# EasyEDA Pro project Zuko.epro, board Honor
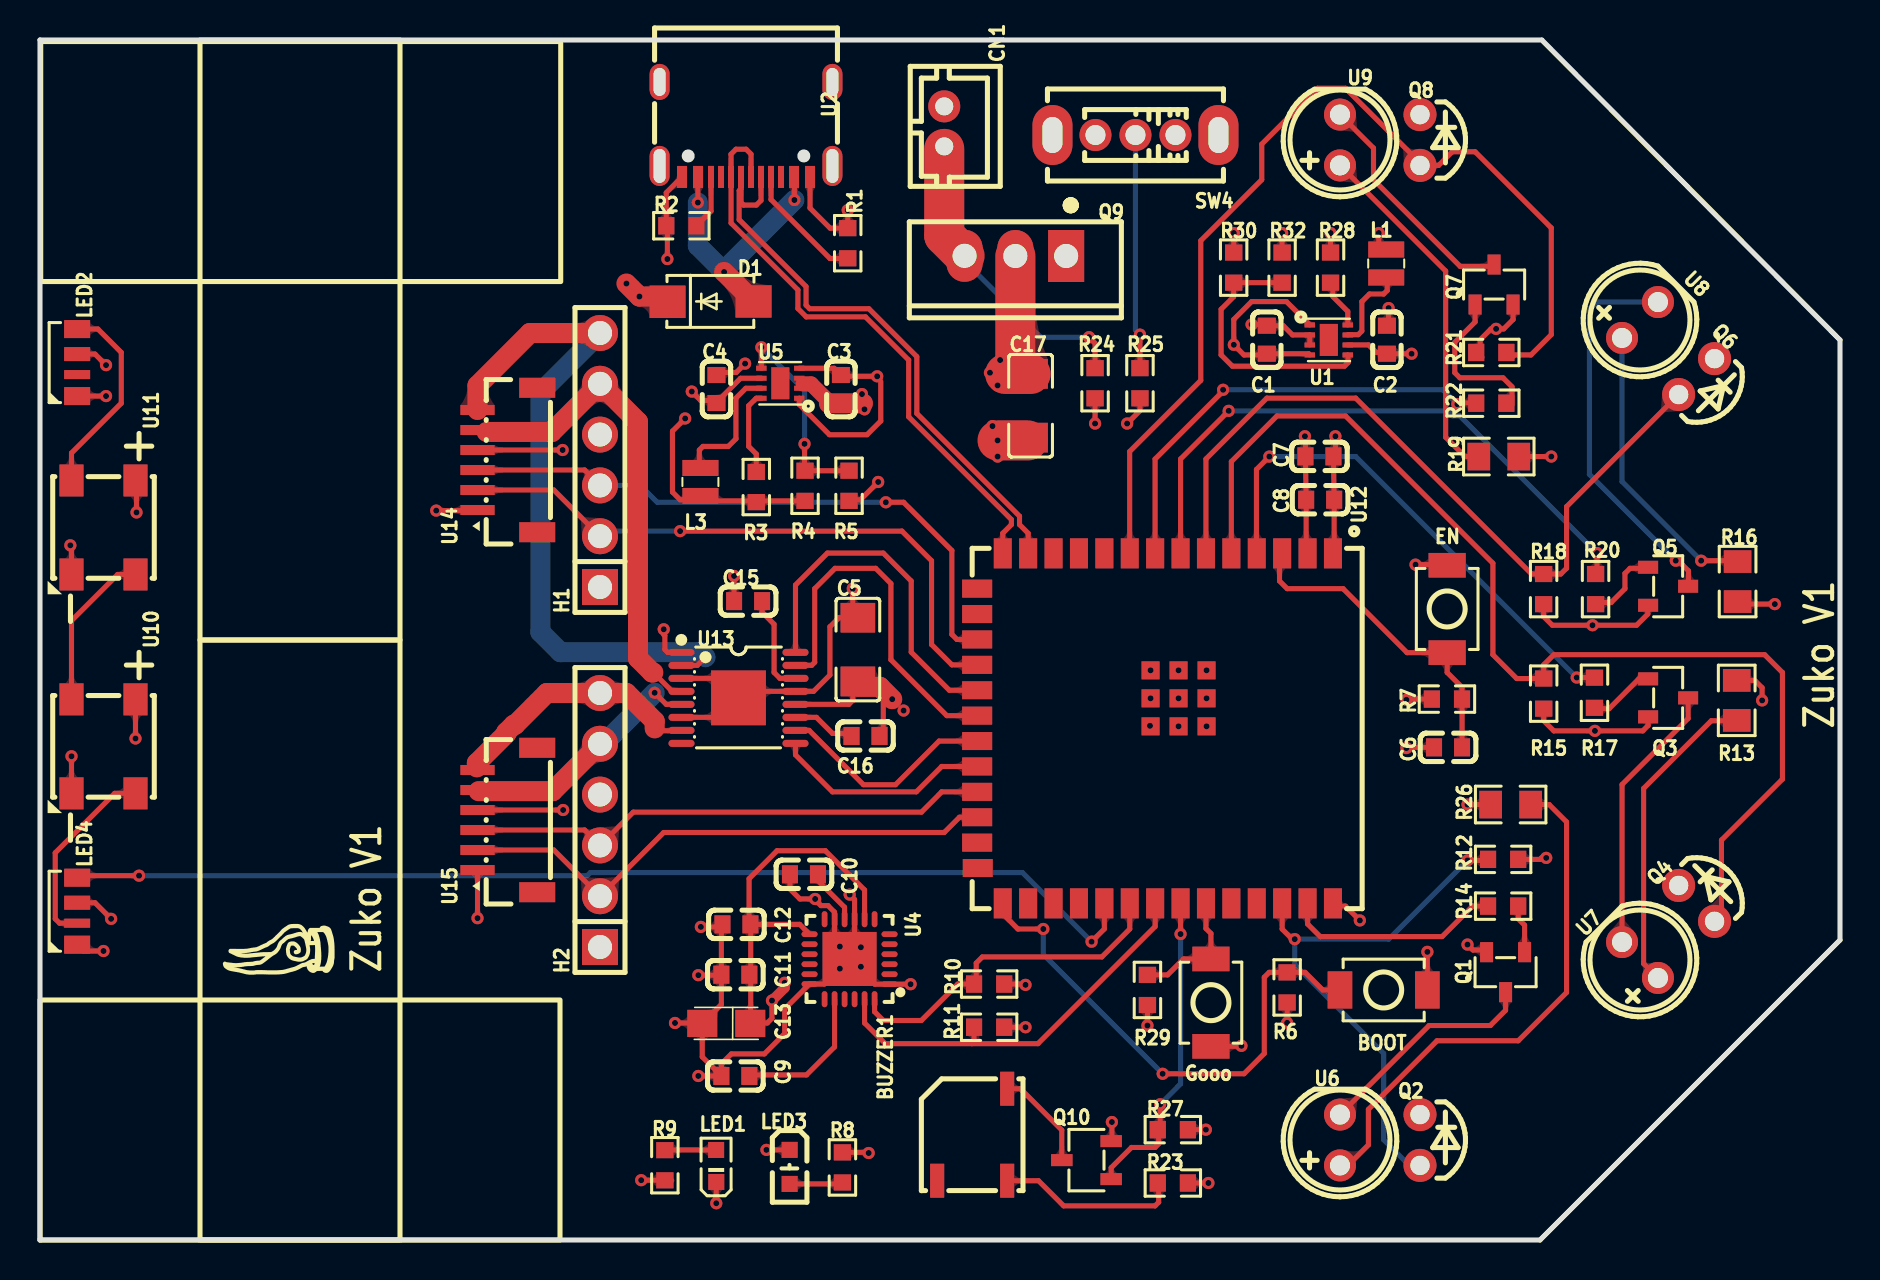
[diagram p1: board, top side]
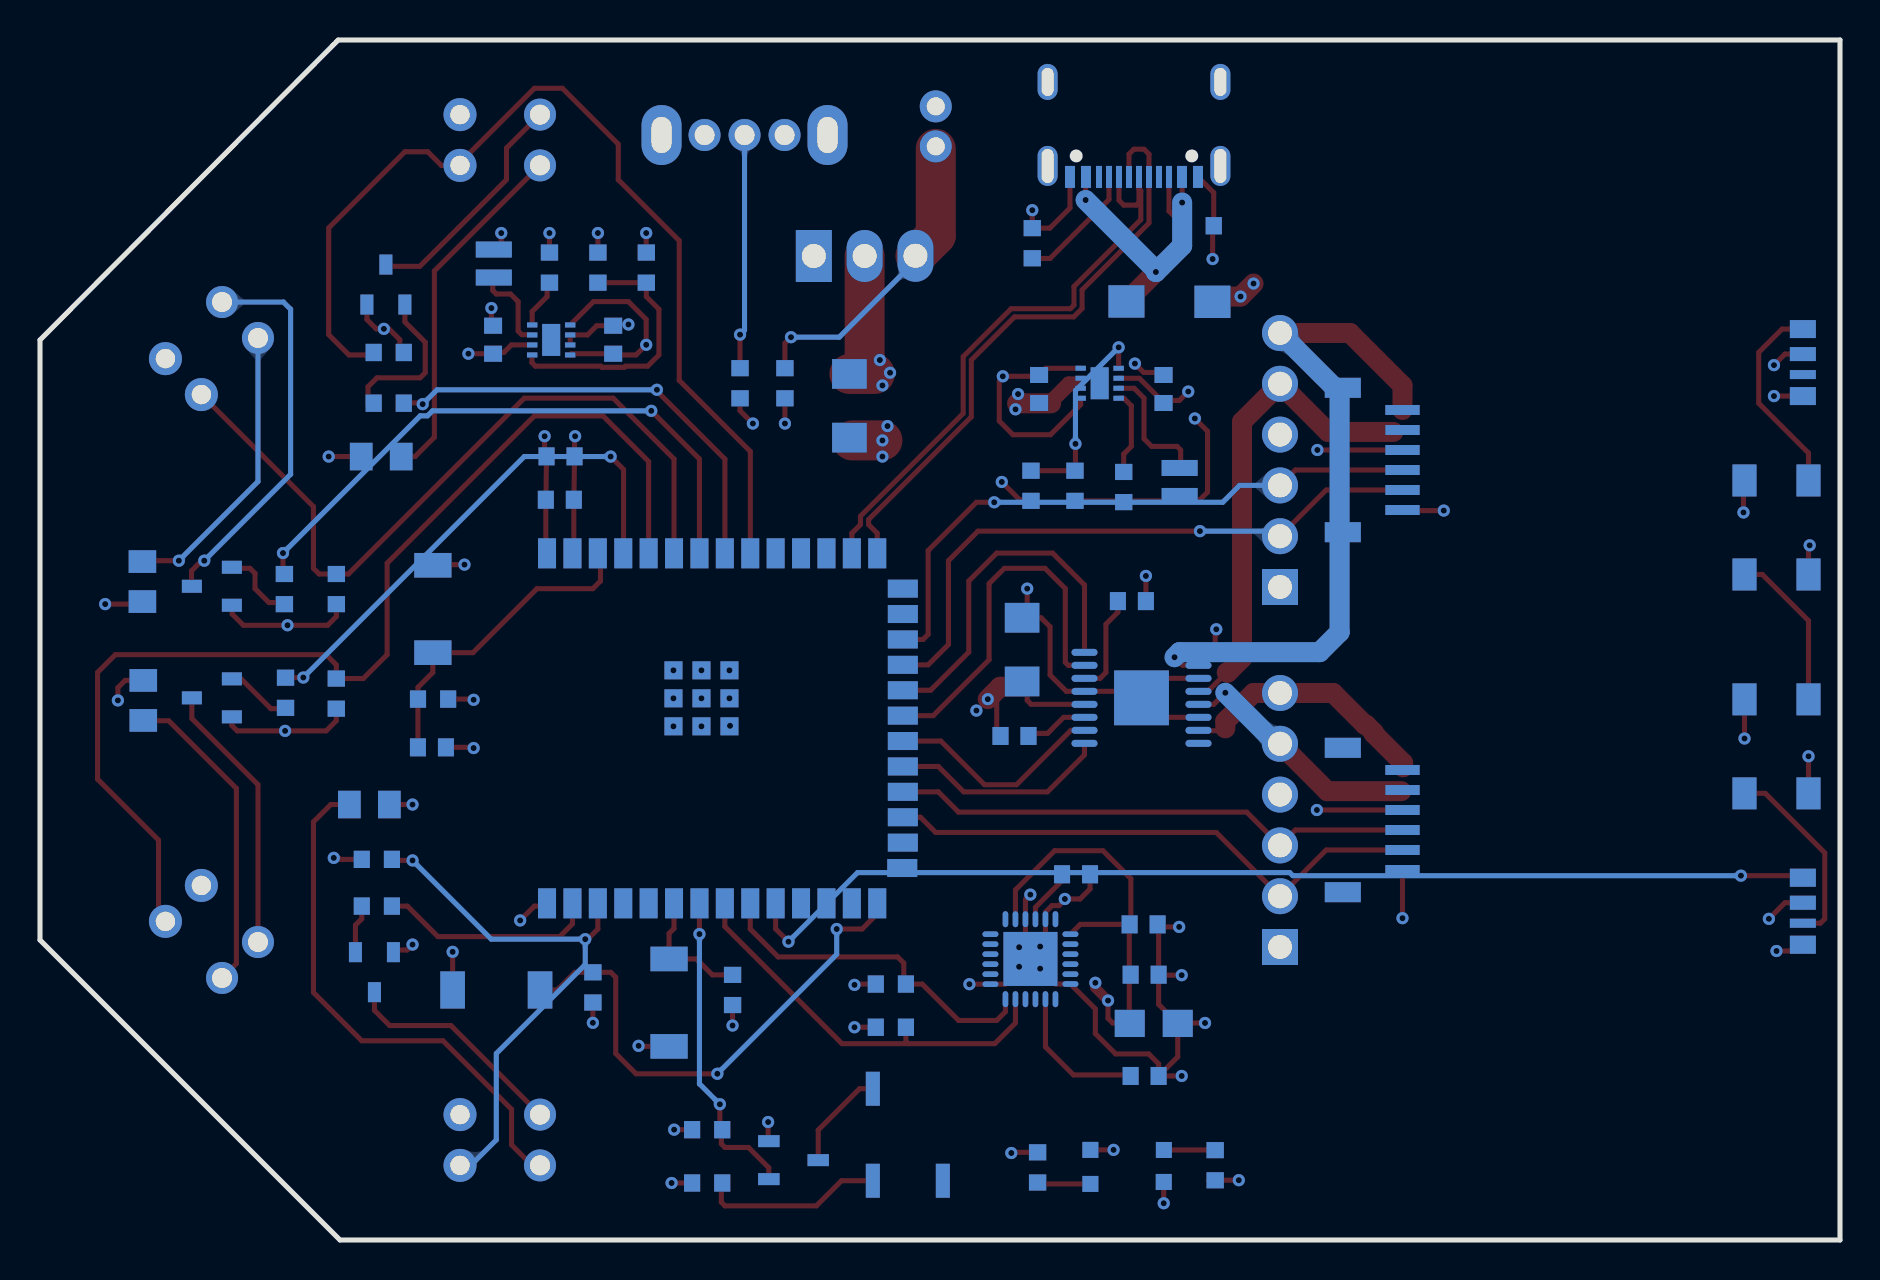
[diagram p2: board, bottom side, seen from below]

Outline 90 x 60 mm; copper layers: Top Layer, Inner1, Inner2, Bottom Layer. Coordinates in mm from the lower left corner of the outline.
Outline path: 0,60 0,0 75,0 90,15 90,45 75.09,60 0,60
Stack: Top Layer 0.035mm Outer layer thickness 1oz / Dielectric1 0.2104mm 7628 RC49% 8.6mil / Inner1 0.0152mm Inner layer thickness / Dielectric2 1.065mm 1.1mm H/HOZ Copper / Inner2 0.0152mm Inner layer thickness / Dielectric3 0.2104mm 7628 RC49% 8.6mil / Bottom Layer 0.035mm Outer layer thickness 1oz

## Design rules (mm)
net USB-D+: DP1
net USB-D-: DP1
spacing copperThickness1oz (default): track to track 0.102, other pairs 0.152 to 0.3
spacing copperThickness2oz: track to track 0.203, other pairs 0.152 to 0.3
track width copperThickness1oz (default): min 0.127, default 0.254, max 2.54
track width copperThickness2oz: min 0.203, default 0.254, max 2.54
differential pair differentialPair (default): width min 0.127, default 0.254, max 2.54; gap min 0.152, default 0.152
net 7.4V uses copperRegion
net 5V uses copperRegion
net 3.3V uses copperRegion
net GND uses copperRegion

## Placement (name value [footprint] x y rotation side)
BOOT  TS-1088-AR02016  [SW-SMD_L3.9-W3.0-P4.45]  67.18 12.5 0 top
BUZZER1  4kHz  [BUZ-SMD_L5.0-W5.5-P4.60]  46.61 5.26 90 top
C1  10uF  [C0603]  61.34 45.01 90 top
C2  22uF  [C0603]  67.35 45.01 270 top
C3  10uF  [C0603]  40.05 42.55 270 top
C4  22uF  [C0603]  33.82 42.55 270 top
C5  47uF  [C1206]  40.89 29.52 270 top
C6  100nF  [C0603]  70.4 24.63 180 top
C7  22uF  [C0603]  63.97 39.18 180 top
C8  100nF  [C0603]  64.01 37.01 0 top
C9  2.2nF  [C0603]  34.77 8.2 0 top
C10  10uF  [C0603]  38.2 18.29 0 top
C11  100nF  [C0603]  34.77 13.26 180 top
C12  100nF  [C0603]  34.82 15.78 180 top
C13  22uF  [CASE-A_3216]  34.31 10.83 180 top
C15  2.2uF  [C0603]  35.41 31.94 0 top
C16  10nF  [C0603]  41.28 25.2 0 top
C17  47uF  [C1206]  49.53 41.71 90 top
CN1  B2B-PH-K-S(LF)(SN)  [CONN-TH_B2B-PH-K-S]  45.21 55.68 270 top
D1  SS24  [SMA_L4.3-W2.6-LS5.0-FD]  33.53 46.92 180 top
EN  TS-1088-AR02016  [SW-SMD_L3.9-W3.0-P4.45]  70.36 31.55 90 top
Gooo  TS-1088-AR02016  [SW-SMD_L3.9-W3.0-P4.45]  58.55 11.87 270 top
H1  2.54-1x6P直针  [HDR-TH_6P-P2.54-V-M-1]  28 39 90 top
H2  2.54-1x6P直针  [HDR-TH_6P-P2.54-V-M-1]  28 21 90 top
L1  2.2uH  [IND-SMD_L2.0-W1.6_WPN2016X]  67.31 48.82 90 top
L3  2.2uH  [IND-SMD_L2.0-W1.6_WPN2016X]  33.02 37.9 270 top
LED1  F.0603.00025/P2-0603G1TS2-06T-002  [LED0603-RD_GREEN]  33.81 3.7 90 top
LED2  WS2812C-4020-H2  [LED-SMD_4P-L4.0-W1.7_DCS-CA4020A0R02G02B02CE004]  1.86 43.87 270 top
LED3  SZYY0603Y  [LED0603-R-RD_YELLOW]  37.48 3.66 270 top
LED4  WS2812C-4020-H2  [LED-SMD_4P-L4.0-W1.7_DCS-CA4020A0R02G02B02CE004]  1.86 16.44 270 top
Q1  BS170FTA  [SOT-23-3_L2.9-W1.3-P1.90-LS2.4-BR]  73.28 13.39 90 top
Q2  TEFT4300  [SENSOR-TH_TEFT4300]  69 5 0 top
Q3  BS170FTA  [SOT-23-3_L2.9-W1.3-P1.90-LS2.4-BR]  81.41 27.11 180 top
Q4  TEFT4300  [SENSOR-TH_TEFT4300]  82.83 16.83 45 top
Q5  BS170FTA  [SOT-23-3_L2.9-W1.3-P1.90-LS2.4-BR]  81.41 32.69 180 top
Q6  TEFT4300  [SENSOR-TH_TEFT4300]  82.83 43.17 315 top
Q7  BS170FTA  [SOT-23-3_L2.9-W1.3-P1.90-LS2.4-BR]  72.71 47.77 270 top
Q8  TEFT4300  [SENSOR-TH_TEFT4300]  69 55 0 top
Q9  FQP27P06(UMW)  [TO-220-3_L10.0-W4.5-P2.54-L]  48.77 49.2 180 top
Q10  2N7002K-T1-GE3  [SOT-23-3_L2.9-W1.6-P1.90-LS2.8-BR]  52.32 3.99 0 top
R1  5.1kΩ  [R0603]  40.39 49.84 270 top
R2  5.1kΩ  [R0603]  32.07 50.71 0 top
R3  100kΩ  [R0603]  35.81 37.65 90 top
R4  680kΩ  [R0603]  38.25 37.71 270 top
R5  130kΩ  [R0603]  40.45 37.71 270 top
R6  10kΩ  [R0603]  62.36 12.63 270 top
R7  10kΩ  [R0603]  70.35 27.05 180 top
R8  1kΩ  [R0603]  40.12 3.63 90 top
R9  1kΩ  [R0603]  31.24 3.74 270 top
R10  4.7kΩ  [R0603]  47.46 12.8 0 top
R11  4.7kΩ  [R0603]  47.46 10.64 0 top
R12  10kΩ  [R0603]  73.16 19.03 180 top
R13  15Ω  [R0805]  84.84 26.98 90 top
R14  100Ω  [R0603]  73.16 16.69 180 top
R15  10kΩ  [R0603]  75.18 27.32 90 top
R16  15Ω  [R0805]  84.88 32.92 270 top
R17  100Ω  [R0603]  77.72 27.36 90 top
R18  10kΩ  [R0603]  75.18 32.55 90 top
R19  15Ω  [R0805]  72.94 39.17 0 top
R20  100Ω  [R0603]  77.78 32.55 90 top
R21  10kΩ  [R0603]  72.56 44.38 0 top
R22  100Ω  [R0603]  72.56 41.84 180 top
R23  100Ω  [R0603]  56.64 2.85 0 top
R24  1MΩ  [R0603]  52.75 42.84 90 top
R25  100Ω  [R0603]  55 42.84 270 top
R26  15Ω  [R0805]  73.53 21.77 180 top
R27  1kΩ  [R0603]  56.64 5.52 180 top
R28  100kΩ  [R0603]  64.53 48.62 270 top
R29  1kΩ  [R0603]  55.37 12.5 270 top
R30  150kΩ  [R0603]  59.68 48.62 90 top
R32  470kΩ  [R0603]  62.1 48.62 90 top
SW4  SS12D07VG4 087  [SW-TH_SS12D07VG4]  54.77 55.25 180 top
U1  TPS62160QDSGRQ1  [WSON-8_L2.0-W2.0-P0.50-TL-EP]  64.44 45 0 top
U2  HX TYPE-C 16PIN  [TYPE-C-SMD_HX-TYPE-C-16PIN]  35.3 55.53 180 top
U4  MPU-6050  [QFN-24_L4.0-W4.0-P0.50-BL-EP2.7]  40.48 14.04 90 top
U5  TPS62160QDSGRQ1  [WSON-8_L2.0-W2.0-P0.50-TL-EP]  37.02 42.84 180 top
U6  SFH 4545-DWEW  [LED-TH_BD5.6-P2.54-FD]  65 5 90 top
U7  SFH 4545-DWEW  [LED-TH_BD5.6-P2.54-FD]  80 14 135 top
U8  SFH 4545-DWEW  [LED-TH_BD5.6-P2.54-FD]  80 46 45 top
U9  SFH 4545-DWEW  [LED-TH_BD5.6-P2.54-FD]  65 55 90 top
U10  WS2812  [LED-SMD_4P-L5.0-W5.0-TL-A]  3.17 24.68 270 top
U11  WS2812  [LED-SMD_4P-L5.0-W5.0-TL-A]  3.17 35.63 270 top
U12  2.4GHz  [WIRELM-SMD_ESP32-S3-WROOM-1U]  55.75 25.58 270 top
U13  DRV8833PWPR  [TSSOP-16_L5.0-W4.4-P0.65-LS6.4-BL-EP]  34.93 27.11 270 top
U14  HC-1.0-6PLT  [CONN-SMD_6P-P1.00_HCTL_HC-1.0-6PLT]  23.37 39 90 top
U15  HC-1.0-6PLT  [CONN-SMD_6P-P1.00_HCTL_HC-1.0-6PLT]  23.37 21 90 top

## Footprints (pads in the part's own frame, mm; a bottom-side part is the same pattern mirrored in y, then rotated)
BUZ-SMD_L5.0-W5.5-P4.60
  rect 1.7x0.7 hole 0.001: 1(-2.3,-1.75) 2(2.3,-1.75) 3(-2.3,1.75)
C0603
  rect 0.8x0.9 hole 0.001: 1(-0.7,0) 2(0.7,0)
C1206
  rect 1.485x1.728 hole 0.001: 1(-1.593,0) 2(1.593,0)
CASE-A_3216
  rect 1.5x1.359 hole 0.001: 1(-1.2,0) 2(1.2,0)
CONN-SMD_6P-P1.00_HCTL_HC-1.0-6PLT
  rect 0.5x1.71 hole 0.001: 1(-2.5,1.492) 2(-1.5,1.492) 3(-0.5,1.492) 4(0.5,1.492) 5(1.5,1.492) 6(2.501,1.492)
  rect 1x1.8 hole 0.001: 7(3.611,-1.492) 8(-3.611,-1.492)
CONN-TH_B2B-PH-K-S
  round 1.6 hole 0.9: 1(1,0) 2(-1,0)
HDR-TH_6P-P2.54-V-M-1
  rect 1.8x1.8 hole 1.2: 1(-6.35,0)
  round 1.8 hole 1.2: 2(-3.81,0) 3(-1.27,0) 4(1.27,0) 5(3.81,0) 6(6.35,0)
IND-SMD_L2.0-W1.6_WPN2016X
  rect 0.8x1.8 hole 0.001: 1(-0.7,0) 2(0.7,0)
LED0603-R-RD_YELLOW
  rect 0.8x0.8 hole 0.001: 1(0.851,0) 2(-0.851,0)
LED0603-RD_GREEN
  rect 0.8x0.8 hole 0.001: 1(-0.799,-0.004) 2(0.799,0.004)
LED-SMD_4P-L4.0-W1.7_DCS-CA4020A0R02G02B02CE004
  rect 0.9x1.3 hole 0.001: 1(-1.675,0) 4(1.675,0)
  rect 0.7x1.3 hole 0.001: 2(-0.425,0)
  rect 0.45x1.3 hole 0.001: 3(0.6,0)
LED-SMD_4P-L5.0-W5.0-TL-A
  rect 1.6x1.2 hole 0.001: 1(-2.35,1.6) 2(-2.35,-1.6) 3(2.35,-1.6) 4(2.35,1.6)
LED-TH_BD5.6-P2.54-FD
  round 1.6 hole 1: 1(-1.27,0) 2(1.27,0)
QFN-24_L4.0-W4.0-P0.50-BL-EP2.7
  oval 0.28x0.8 hole 0.001: 1(-1.25,-2) 2(-0.75,-2) 3(-0.25,-2) 4(0.25,-2) 5(0.75,-2) 6(1.25,-2) 13(1.25,2) 14(0.75,2) 15(0.25,2) 16(-0.25,2) 17(-0.75,2) 18(-1.242,2)
  oval 0.8x0.28 hole 0.001: 7(2,-1.25) 8(2,-0.75) 9(2,-0.25) 10(2,0.25) 11(2,0.75) 12(2,1.25) 19(-2,1.25) 20(-2,0.75) 21(-2,0.25) 22(-2,-0.25) 23(-2,-0.75) 24(-2,-1.25)
  rect 2.7x2.7 hole 0.001: 25(0.013,0)
R0603
  rect 0.806x0.864 hole 0.001: 1(-0.753,0) 2(0.753,0)
R0805
  rect 1.133x1.377 hole 0.001: 1(-1,0) 2(1,0)
SENSOR-TH_TEFT4300
  round 1.651 hole 0.965: 1(0,1.27) 2(0,-1.27)
SMA_L4.3-W2.6-LS5.0-FD
  rect 1.8x1.62 hole 0.001: 1(-2.15,-0.009) 2(2.15,0.009)
SOT-23-3_L2.9-W1.3-P1.90-LS2.4-BR
  rect 1x0.65 hole 0.001: 1(1,-0.95) 2(1,0.95) 3(-1,0)
SOT-23-3_L2.9-W1.6-P1.90-LS2.8-BR
  rect 1.07x0.6 hole 0.001: 1(1.235,-0.95) 2(1.235,0.95) 3(-1.235,0)
SW-SMD_L3.9-W3.0-P4.45
  rect 1.23x1.86 hole 0.001: 1(-2.185,0) 2(2.185,0)
SW-TH_SS12D07VG4
  oval 1.6x1.6 hole 1: 1(-2,0) 2(0,0) 3(2,0)
  oval 2x3 hole 1x1.8: 4(4.15,0) 5(-4.15,0)
TO-220-3_L10.0-W4.5-P2.54-L
  rect 1.8x2.6 hole 1.2: 1(-2.54,0.005)
  oval 1.8x2.6 hole 1.2: 2(0,0.005) 3(2.54,-0.005)
TSSOP-16_L5.0-W4.4-P0.65-LS6.4-BL-EP
  oval 0.35x1.3 hole 0.001: 1(-2.275,-2.85) 2(-1.625,-2.85) 3(-0.975,-2.85) 4(-0.325,-2.85) 5(0.325,-2.85) 6(0.975,-2.85) 7(1.625,-2.85) 8(2.275,-2.85) 9(2.275,2.85) 10(1.625,2.85) 11(0.975,2.85) 12(0.325,2.85) 13(-0.325,2.85) 14(-0.975,2.85) 15(-1.625,2.85) 16(-2.275,2.85)
  rect 2.74x2.74 hole 0.001: 17(0,0)
TYPE-C-SMD_HX-TYPE-C-16PIN
  oval 1x2 hole 0.6x1.7: 17(-4.32,1.825) 20(4.32,1.825)
  oval 1x1.8 hole 0.6x1.4: 18(-4.32,-2.376) 19(4.32,-2.376)
  rect 0.3x1.1 hole 0.001: A5(-1.25,2.374) A6(-0.25,2.374) A7(0.25,2.374) A8(1.25,2.376) B5(1.75,2.374) B6(0.75,2.374) B7(-0.75,2.374) B8(-1.75,2.376)
  rect 0.5x1.1 hole 0.001: A9B4(2.4,2.375) A12B1(3.2,2.375) B9A4(-2.4,2.375) B12A1(-3.2,2.375)
WIRELM-SMD_ESP32-S3-WROOM-1U
  rect 1.5x0.9 hole 0.001: 1(-8.75,8.895) 2(-8.75,7.625) 3(-8.75,6.355) 4(-8.75,5.085) 5(-8.75,3.815) 6(-8.75,2.545) 7(-8.75,1.275) 8(-8.75,0.005) 9(-8.75,-1.265) 10(-8.75,-2.535) 11(-8.75,-3.805) 12(-8.75,-5.075) 13(-8.75,-6.345) 14(-8.75,-7.615) 27(8.75,-7.615) 28(8.75,-6.345) 29(8.75,-5.075) 30(8.75,-3.805) 31(8.75,-2.535) 32(8.75,-1.265) 33(8.75,0.005) 34(8.75,1.275) 35(8.75,2.545) 36(8.75,3.815) 37(8.75,5.085) 38(8.75,6.355) 39(8.75,7.625) 40(8.75,8.895)
  rect 0.9x1.5 hole 0.001: 15(-6.985,-8.895) 16(-5.715,-8.895) 17(-4.445,-8.895) 18(-3.175,-8.895) 19(-1.905,-8.895) 20(-0.635,-8.895) 21(0.635,-8.895) 22(1.905,-8.895) 23(3.175,-8.895) 24(4.445,-8.895) 25(5.715,-8.895) 26(6.985,-8.865)
  rect 0.9x0.9 hole 0.001: 41(-2.9,2.575) 41(-2.9,1.175) 41(-2.9,-0.225) 41(-1.5,2.575) 41(-1.5,1.175) 41(-1.5,-0.225) 41(-0.1,2.575) 41(-0.1,1.175) 41(-0.1,-0.225)
WSON-8_L2.0-W2.0-P0.50-TL-EP
  rect 0.521x0.25 hole 0.001: 1(-0.95,0.75) 2(-0.95,0.25) 3(-0.95,-0.25) 4(-0.95,-0.75) 5(0.95,-0.75) 6(0.95,-0.25) 7(0.95,0.25) 8(0.95,0.75)
  rect 0.9x1.6 hole 0.001: 9(0,0)

## Nets
As in the schematic.

Pads without a net: BUZZER1 3; LED2 3; SW4 3 4 5; U1 9; U2 17 18 19 20 A8 B8; U4 2 3 4 5 6 7 12 14 15 16 17 19 21 22; U5 9; U12 10 11 12 15 16 25 26 28 29 30 36 37; U13 8; U14 7 8; U15 7 8

## Via types
v1: diameter 0.61, hole 0.305, Top Layer to Bottom Layer, 121 vias

## Routing (per net, layer and track width the routed paths; a pad name or vN(x,y) marks a point on that pad's centre or on a via; arc(x,y) is an arc through that point)
3.3V: length 60.1
  Top Layer w0.254: U4.13 37.99,15.78 35.54,15.78 35.54,10.85 ; R23.2 v1(58.42,2.85) ; 35.54,10.85 C13.1 ; 35.54,10.85 36.37,10.85 36.6,11.08 v1(36.6,11.97) ; U14.4 v1(26.13,39.5) ; R6.2 v1(62.36,10.86) ; 74.15,39.17 v1(75.56,39.17) ; v1(68.58,44.31) C2.2 67.28,44.38 66.8,44.38 66.43,44.75 U1.6 ; C12.1 35.46,15.85 35.46,18.07 36.85,19.46 39.27,19.46 41.23,17.5 U4.8 ; v1(68.32,27.01) 68.35,27.05 R7.2 ; 85.07,27.98 85.74,27.98 86.11,27.61 v1(86.11,26.98) ; 85.07,27.98 85.11,27.94 ; 85.07,27.98 85.05,28 ; 85.07,27.98 R13.2 ; v1(41.43,4.35) 41.4,4.38 R8.2 ; R10.2 49.24,12.8 v1(49.28,12.76) ; R29.2 v1(55.37,10.72) ; U13.1 31.38,29.38 31.24,29.52 31.24,30.22 31.19,30.27 v1(31.19,30.54) ; 63.27,39.31 63.27,40.16 v1(63.25,40.19) ; 63.27,39.31 C7.2 ; 63.27,39.31 63.31,36.8 ; 63.31,37.06 63.31,36.8 ; 63.31,36.8 63.31,34.4 U12.2 ; U15.4 v1(26.16,21.5) ; 72.41,21.27 72.41,21.76 72.39,21.77 v1(71.37,21.77) ; 84.88,31.8 v1(86.74,31.8) ; 66.94,49.36 v1(66.94,50.35) ; R11.2 v1(49.28,10.64) ; R28.1 v1(64.53,50.35) ; R32.2 v1(62.1,50.35)
  Top Layer w0.5: v1(37.23,12.86) 37.23,12.61 v1(36.6,11.97)
5V: length 25.7
  Top Layer w0.254: U10.3 v1(1.58,24.19) ; v1(3.56,16.06) 2.75,16.86 LED4.2 ; 31.58,2.97 31.57,2.99 v1(30.06,2.99) ; LED2.2 2.75,44.3 v1(3.3,43.74) ; U11.3 1.58,34.68 v1(1.52,34.73) ; v1(32.59,42.42) 33.03,41.98 33.82,41.98 ; 38.25,36.96 33.84,36.96 33.79,37.01 32,37.01 31.62,37.39 31.62,40.44 v1(32.26,41.08) ; 34.08,41.98 34.08,42.13 35.03,43.09 U5.6
  Top Layer w1: D1.2 31.11,47.17 v1(29.97,47.17) v1(29.32,47.82)
7.4V: length 21.6
  Top Layer w0.254: U1.3 U1.2 62.63,45.25 62.16,45.71 C1.2 61.28,45.78 v1(60.58,45.78) ; 41.85,25.08 42.16,25.39 42.16,27.2 ; 40.64,27.93 40.64,26.98 40.44,26.78 U13.12
  Top Layer w0.75: 38.16,42.8 38.56,42.8 39.45,41.92
  Top Layer w1: 39.45,41.83 41.15,41.83 ; 40.89,27.66 41.99,27.66 v1(42.61,27.04)
  Top Layer w2: Q9.2 48.77,44 ; C17.2 48.26,43.3
  vias: v1(41.1,42.3) v1(41.22,41.53) v1(43.18,26.47) v1(47.5,43.36) v1(47.88,42.73) v1(48.01,44)
GND: length 142.6
  Top Layer w0.254: 64.71,36.8 64.71,34.39 U12.1 ; 64.71,36.8 64.67,39.31 64.74,39.31 64.77,39.28 v1(64.77,40.19) ; 64.71,36.8 64.71,37.06 ; 34.43,27.61 33.95,28.08 U13.3 ; BOOT.2 v1(69.37,14.41) ; v1(19.81,36.47) 21.85,36.47 U14.1 ; LED2.4 v1(3.3,42.2) ; 70.34,33.36 69.93,33.77 v1(68.78,33.77) ; v1(53.59,5.9) 53.59,4.98 53.56,4.94 ; R30.2 59.69,49.38 v1(59.69,50.35) ; v1(71.37,14.77) 71.65,14.5 72.22,14.5 Q1.2 ; R25.2 55,41.47 v1(54.36,40.82) ; 75.18,31.87 75.18,31.17 75.62,30.74 v1(77.62,30.74) 79.83,30.74 80.39,31.3 80.39,31.86 80.41,31.87 ; U4.25 39.73,14.8 U4.11 39.73,16.39 39.4,16.72 39.05,16.72 38.76,17.01 v1(38.76,17.05) 38,17.05 37.5,17.55 C10.1 ; U4.25 v1(39.99,13.57) 39.22,12.8 U4.18 37.23,11.55 37.23,10.32 36.22,9.3 34.57,9.3 34.07,8.81 C9.1 ; U4.25 40.73,14.3 U4.9 40.73,17.03 v1(40.48,17.27) ; U4.25 41.74,12.79 U4.1 v1(43.53,12.79) ; R27.1 v1(58.29,5.52) ; C9.1 33.11,9.16 C13.2 ; C9.1 v1(32.92,8.2) ; Gooo.2 60.04,9.68 v1(60.07,9.71) ; v1(65.99,15.98) 65.28,16.69 64.79,16.69 U12.40 ; LED4.4 2.17,14.45 v1(3.17,14.45) ; C13.2 34.07,11.78 C11.2 ; C13.2 33.09,10.85 v1(31.75,10.85) ; C5.1 39.95,31.11 39.5,30.66 39.5,28.25 38.68,27.43 U13.13 35.25,27.43 U13.17 33.95,26.13 U13.6 ; 37.97,43.59 39.71,43.59 C3.1 40.11,43.19 v1(41.86,43.19) ; R24.1 v1(52.75,40.82) ; 40.45,36.96 40.51,37.01 41.02,37.01 v1(41.91,37.9) ; 73.66,46.68 73.66,46.03 73.19,45.56 v1(72.81,45.56) 72.55,45.56 72.01,45.01 72.01,44.21 72.09,44.13 ; C11.2 34.07,15.64 34.06,15.65 v1(33.04,15.65) ; C11.2 34.05,13.24 v1(32.92,13.24) ; 33.82,43.38 34.81,43.38 v1(35.25,43.82) ; v1(40.39,51.49) R1.1 39.51,50.59 38.5,51.6 U2.B12A1 ; U15.1 v1(21.88,16.09) ; C15.1 v1(34.71,33.2) ; LED1.1 v1(33.81,1.84) ; 74.04,19.03 75,19.03 75.07,19.11 v1(75.31,19.11) ; U1.4 63.43,44.31 C1.1 61.28,44.25 60.2,44.25 v1(59.69,44.76) 59.69,46.03 60.58,46.92 62.32,46.92 U1.1 ; C2.1 67.43,45.8 v1(67.43,46.6) ; v1(31.37,49.05) 31.37,50.66 R2.1 31.31,52.37 U2.A12B1 ; 42.04,42.93 42.04,40.95 41.35,40.26 39.47,40.26 37.97,41.77 37.97,42.09 ; LED3.2 v1(36.32,4.51) ; 4.78,27.03 v1(4.78,25.08) ; Q3.2 80.41,25.73 80.14,25.46 v1(77.75,25.46) 75.69,25.46 75.18,25.96 R15.1 ; v1(68.32,24.6) 68.35,24.63 C6.2 ; v1(4.83,36.38) 4.83,37.93 4.78,37.98 ; 40.64,31.38 v1(40.64,32.57)
  Top Layer w2: 49.39,39.98 v1(47.88,39.98)
  vias: v1(39.99,14.67) v1(41.04,14.64) v1(41.04,13.66) v1(47.62,40.7) v1(47.88,39.17) v1(55.53,28.48) v1(55.53,27.08) v1(55.5,25.71) v1(56.93,28.48) v1(56.93,27.08) v1(56.93,25.68) v1(58.33,28.48) v1(58.33,27.08) v1(58.33,25.68)
VBUS: length 13.6
  Top Layer w0.254: v1(37.72,52) 37.72,53.13 U2.B9A4 ; U2.A9B4 32.89,53.15 v1(32.89,51.87)
  Top Layer w1: D1.1 v1(34.21,48.4)
  Bottom Layer w1: v1(32.89,51.87) 32.89,49.71 v1(34.21,48.4) 34.21,48.49 v1(37.72,52)
BOOT: length 26.1
  Top Layer w0.254: v1(56.13,8.31) 60.2,8.31 61.21,9.33 61.21,13.14 61.46,13.38 R6.1 63.25,13.38 64.13,12.5 BOOT.1 ; v1(50.16,15.55) 48.9,15.55 48.17,16.27 48.17,16.78
  Bottom Layer w0.254: v1(56.13,8.31) 50.16,14.28 v1(50.16,15.55)
Buzzer: length 16
  Top Layer w0.254: Q10.1 53.56,3.61 54.57,4.63 55.75,4.63 55.93,4.81 55.93,5.47 R27.2 56.01,5.64 v1(56.01,6.79) ; U12.34 v1(57.03,15.3)
  Bottom Layer w0.254: v1(57.03,15.3) 57.03,7.81 v1(56.01,6.79)
EMITTER 1: length 0.9
  Top Layer w0.254: 64.01,15.17 63.38,15.8
Emitter 1: length 9.7
  Top Layer w0.254: 63.38,15.8 U12.39 ; 72.01,16.69 71.63,16.69 70.1,15.17 64.01,15.17
Emitter 2: length 26.1
  Top Layer w0.254: v1(76.84,28.12) 77.81,28.12 77.86,28.07 ; v1(61.47,39.17) 60.82,38.53 60.82,34.45 60.71,34.33
  Bottom Layer w0.254: v1(61.47,39.17) 65.79,39.17 v1(76.84,28.12)
Emitter 3: length 30.6
  Top Layer w0.254: R20.2 77.85,33.37 v1(77.85,34.35) ; U12.7 57.03,39.05 v1(59.44,41.46)
  Bottom Layer w0.254: v1(77.85,34.35) 70.99,41.21 70.62,41.21 70.38,41.46 v1(59.44,41.46)
EMITTER 4: length 21.6
  Top Layer w0.254: v1(59.16,42.51) 59.16,42.45 55.75,39.05 55.75,34.34 55.76,34.33
  Bottom Layer w0.254: 70.87,41.79 70.15,42.51 v1(59.16,42.51)
Emitter 4: length 0.8
  Top Layer w0.254: 71.65,41.86 70.93,41.86 v1(70.87,41.79)
EN: length 16.3
  Top Layer w0.254: U12.3 61.98,34.2 61.98,32.95 62.36,32.57 65.15,32.57 68.35,29.37 EN.1 70.36,28.38 71.1,27.63 R7.1 71.1,27.04 71.1,24.63
ENC L A: length 30.9
  Top Layer w0.254: U12.17 45.85,30.03 45.59,30.28 45.59,34.47 43.18,36.89 v1(42.29,36.89) ; H1.3 27.23,38.5 U14.3
  Bottom Layer w0.254: v1(42.29,36.89) 30.86,36.89 30.02,37.73 H1.3
ENC L B: length 31.3
  Top Layer w0.254: U12.18 45.59,28.76 44.58,29.77 44.58,33.97 43.1,35.44 v1(32,35.44) ; H1.2 25.69,37.5 U14.2
  Bottom Layer w0.254: H1.2 28.25,35.44 v1(32,35.44)
ENC R A: length 26.4
  Top Layer w0.254: U15.3 27.23,20.5 H2.3 29.66,21.39 44.07,21.39 45.09,22.41 U12.23
ENC R B: length 27.6
  Top Layer w0.254: U15.2 25.69,19.5 H2.2 31.19,20.38 45.21,20.38 45.97,21.14 U12.24
GOOOO: length 1.1
  Top Layer w0.254: 56.38,13.26 57.18,14.05
Goooo: length 5.4
  Top Layer w0.254: 57.18,14.05 Gooo.1 58.73,14.23 58.73,14.49 58.55,14.67 58.55,15.33 58.3,15.58 U12.35 ; R29.1 56.38,13.26
Motor L 1 Logic: length 18
  Top Layer w0.254: U13.16 37.78,32.75 39.37,34.35 42.16,34.35 43.56,32.95 43.56,29.39 45.47,27.49 U12.19
MOTOR L 1 POWER: length 4.9
  Top Layer w1: 24.5,45.35 21.88,42.73 21.88,41.5
Motor L 1 Power: length 29.8
  Top Layer w0.254: U13.2 32.87,28.73 v1(33.27,29.14)
  Top Layer w1: H1.6 24.5,45.35
  Bottom Layer w1: v1(33.27,29.14) 33.02,29.39 26.02,29.39 25.02,30.39 25.02,42.37 H1.6
MOTOR L 2 LOGIC: length 1
  Top Layer w0.254: 37.78,28.73 38.58,28.73 38.74,28.89
Motor L 2 Logic: length 17.5
  Top Layer w0.254: 38.74,28.89 38.74,32.57 39.75,33.58 41.78,33.58 42.54,32.82 42.54,29.01 45.34,26.22 U12.20
Motor L 2 Power: length 24
  Top Layer w0.254: U13.4 31.61,27.43 30.66,28.38
  Top Layer w1: 30.66,28.38 30.61,28.38 29.9,29.08 29.9,40.91 H1.5 25.59,40.4 22.33,40.4
Motor R 1 Logic: length 10.9
  Top Layer w0.254: U13.9 37.78,24.26 39.62,22.41 43.81,22.41 45.09,23.68 U12.22
MOTOR R 1 POWER: length 11.5
  Top Layer w1: 30.73,25.58 30.73,25.94 29.32,27.35 28,27.35 25.34,27.35 23.76,25.76 23.69,25.76 23.31,25.38 23.31,25.31 21.84,23.85 21.84,23.63
Motor R 1 Power: length 1.2
  Top Layer w0.254: U13.7 32.06,25.46 30.86,25.46
Motor R 2 Logic: length 11.1
  Top Layer w0.254: U13.10 38.46,25.48 41.17,22.76 42.77,22.76 44.96,24.95 U12.21
Motor R 2 Power: length 12.4
  Top Layer w0.254: U13.5 31.31,26.78 v1(30.73,27.36)
  Top Layer w1: H2.5 25.63,22.44 21.93,22.44
  Bottom Layer w1: H2.5 28.18,24.81 v1(30.73,27.36)
Receiver 1: length 27.7
  Top Layer w0.254: 72.57,19.03 72.52,18.98 v1(71.37,18.98) ; 62.61,15.04 62.11,15.55 U12.38
  Bottom Layer w0.254: v1(71.37,18.98) 67.44,15.04 v1(62.74,15.04) 62.74,13.77 67.18,9.33 67.18,5.01 68.38,3.81 69,3.81
RECEIVER 2: length 29.3
  Top Layer w0.254: 59.57,34.33 59.57,38.92 61.85,41.2 65.28,41.2 72.64,33.84 72.64,29.27 73.84,28.07 75.18,28.07
Receiver 2: length 27.1
  Top Layer w0.254: Q4.2 84.07,16.28 84.07,20 87.12,23.04 87.12,28.38 86.23,29.27 75.69,29.27 75.18,28.76 R15.2
Receiver 3: length 38.8
  Top Layer w0.254: Q6.2 76.33,36.67 76.33,33.58 76.04,33.3 R18.2 74.58,33.3 65.79,42.09 61.34,42.09 58.3,39.05 U12.6
Receiver 4: length 50.1
  Top Layer w0.254: 73.6,44.13 73.72,44.25 74.55,44.25 75.56,45.27 75.56,50.6 71.75,54.41 70.61,54.41 69.93,53.73 Q8.2 69,53.86 65.28,57.59 63.88,57.59 61.09,54.79 61.09,53.02 58.04,49.97 58.04,42.98 54.48,39.43 54.48,34.34 U12.9
SCL: length 20.6
  Top Layer w0.254: R11.1 46.7,9.93 46.59,9.82 ; 46.59,9.82 49.9,9.82 55.76,15.68 U12.33 ; 46.59,9.82 42.26,9.82 41.23,10.85 U4.23
SDA: length 17.3
  Top Layer w0.254: U12.32 54.49,15.55 53.09,14.15 47.12,14.15 46.81,13.85 46.81,12.9 R10.1 45.89,12.8 44.07,10.98 42.16,10.98 41.73,11.41 U4.24
USB-D+: length 30
  Top Layer w0.254: U2.A6 35.55,54.29 35.31,54.54 34.8,54.54 34.55,54.29 U2.B6 34.55,50.85 37.9,47.5 37.9,46.57 38.31,46.16 41.28,46.16 43.43,44 43.43,41.16 48.57,36.02 48.57,35.77 48.14,35.34 U12.14
USB-D-: length 30.2
  Top Layer w0.254: U2.B7 36.05,51.98 35.81,51.75 35.18,51.75 35.05,51.87 35.05,53.15 ; U12.13 49.41,35.34 48.98,35.77 48.98,36.19 43.84,41.33 43.84,44.17 41.44,46.56 38.48,46.56 38.3,46.74 38.3,47.67 34.96,51.02 34.96,52.47 35.05,52.56 U2.A7
WS2812: length 54.4
  Top Layer w0.254: v1(52.58,14.92) 53.22,15.56 U12.31 ; LED4.1 1.96,18.22 v1(4.95,18.22)
  Bottom Layer w0.254: v1(4.95,18.22) 27.36,18.22 27.51,18.37 49.12,18.37 v1(52.58,14.92)
$1N20: length 6.2
  Top Layer w0.254: U2.A5 36.55,52.02 39.5,49.08 40.38,49.08 R1.2
$1N21: length 3
  Top Layer w0.254: 33.55,53.41 33.55,51.44 R2.2
$1N44: length 4.3
  Top Layer w0.254: U5.8 35.81,42.09 35.43,41.71 35.43,39.68 35.81,39.3 R3.2
$1N47: length 10.3
  Top Layer w0.254: 36.07,43.59 v1(36.07,44.63) ; v1(38.23,39.81) 38.23,38.49 R4.1 R5.1
  Bottom Layer w0.254: v1(38.23,39.81) 38.23,42.47 v1(36.07,44.63)
$1N62: length 2.7
  Top Layer w0.254: R8.1 40.05,2.8 LED3.1
$1N64: length 2.2
  Top Layer w0.254: LED1.2 31.61,4.5 31.58,4.48
$1N77: length 7.2
  Top Layer w0.254: U4.20 39.73,9.66 38.32,8.25 35.52,8.25 C9.2
$1N81: length 2.5
  Top Layer w0.254: U4.10 40.23,16.64 38.9,17.97
$1N98: length 11.3
  Top Layer w0.254: Q1.3 73.28,11.49 72.52,10.72 69.45,10.72 U6.2
$1N100: length 27.2
  Top Layer w0.254: U6.1 65.4,3.73 66.42,4.75 66.42,6.53 69.85,9.96 73.91,9.96 76.33,12.38 76.33,20.91 75.46,21.77 74.55,21.77 74.41,21.63 74.41,21.27
$1N101: length 2.4
  Top Layer w0.254: R14.1 73.91,16.06 74.23,15.74 Q1.1
$1N103: length 15.8
  Top Layer w0.254: U7.1 80.18,13.82 80.18,22.58 83.57,25.96 84.82,25.96 R13.1
$1N105: length 13.6
  Top Layer w0.254: U7.2 79.1,22.77 82.41,26.08 Q3.3
$1N108: length 3.2
  Top Layer w0.254: Q3.1 79.94,28.06 78.45,26.57 77.86,26.57
$1N112: length 14.6
  Top Layer w0.254: R16.1 84.84,33.97 v1(83.06,33.97)
  Bottom Layer w0.254: v1(83.06,33.97) 79.1,37.92 U8.1
$1N114: length 19.6
  Top Layer w0.254: Q5.3 82.42,32.7 82.42,33.46 81.91,33.97 v1(81.79,33.97)
  Bottom Layer w0.254: U8.2 77.83,46.9 77.47,46.54 77.47,38.28 v1(81.79,33.97)
$1N117: length 3.8
  Top Layer w0.254: 77.86,31.87 78.55,31.87 79.25,32.57 79.25,33.33 79.5,33.58 80.22,33.58 80.41,33.77
$1N121: length 17.8
  Top Layer w0.254: R19.1 71.25,39.17 70.28,40.14 70.28,48.45 U9.1
$1N123: length 11.8
  Top Layer w0.254: U9.2 66.68,54.6 66.68,53.02 71.01,48.68 72.71,48.68
$1N126: length 7.8
  Top Layer w0.254: 71.75,46.68 71.75,45.9 70.74,44.89 70.74,43.36 70.99,43.11 73.15,43.11 73.6,42.66 73.6,41.75
$1N133: length 8.1
  Top Layer w0.254: 4.78,33.28 3.88,33.28 1.58,30.97 U10.2
$1N138: length 9.7
  Top Layer w0.254: 4.78,22.33 3.73,22.33 0.76,19.36 0.76,16.06 0.98,15.84 LED4.3
$1N141: length 10.1
  Top Layer w0.254: LED2.1 2.9,45.55 4.06,44.38 4.06,41.84 1.58,39.35 U11.2
$1N147: length 15.5
  Top Layer w0.254: v1(52.45,45.14) 52.75,44.84 R24.2
  Top Layer w2: 45.21,54.56 45.21,50.23 Q9.3
  Bottom Layer w0.254: Q9.3 46.23,48.95 50.04,45.14 v1(52.45,45.14)
$1N151: length 11.8
  Top Layer w0.254: R25.1 v1(55,45.27)
  Bottom Layer w0.254: v1(55,45.27) 54.77,45.49 SW4.2
$1N168: length 3.1
  Top Layer w0.254: 40.45,25.08 40.19,25.33 39.62,25.33 38.82,26.13 U13.11
$1N176: length 5
  Top Layer w0.254: U13.14 37,28.08 36.7,28.38 36.7,30.79 36.11,31.39 36.11,31.94
$1N274: length 5.1
  Top Layer w0.254: Q10.3 51.09,5.5 49.02,7.56 BUZZER1.2
$1N275: length 9.1
  Top Layer w0.254: R23.1 55.93,2.81 55.93,1.89 55.75,1.71 51.18,1.71 49.93,2.96 BUZZER1.1
$1N290: length 13.4
  Top Layer w0.254: U1.5 65.41,44.24 65.41,43.87 65.23,43.69 61.96,43.69 61.91,43.64 60.78,43.64 60.72,43.69 59.62,43.69 59.06,44.25 59.06,46.54 59.68,47.17 R30.1 R32.1
$1N291: length 2.5
  Top Layer w0.254: R28.2 64.64,47.75 64.64,47.17 65.39,46.43 U1.8
$1N298: length 4.4
  Top Layer w0.254: U1.7 65.41,45.27 65.91,45.27 66.09,45.45 66.09,46.92 66.47,47.3 67.18,47.3 67.36,47.48 67.36,48.07 L1.1
$1N299: length 6.5
  Top Layer w0.254: L3.1 32.97,38.66 32.97,39.5 33.15,39.68 34.42,39.68 34.8,40.06 34.8,42.09 35.29,42.59 U5.7

## Copper pours and planes (outline as drawn; the poured copper is in the pictures)
3.3V on Inner2: 61.55,41.46 67.74,41.42 67.74,46.87 65.28,49.33 61.72,49.33 60.83,50.22 60.83,59.75 62.74,61.65 78.74,61.65 92.71,47.68 92.71,11.99 78.1,-2.61 35.69,-2.61 35.69,3.2 24.76,14.13 24.76,22.78 24.77,22.79 44.83,22.79 61.55,39.5
3.3V on Inner2: 25.4,21.27 24.78,21.88 24.78,22.44 24.77,22.46 24.77,41.46 25.53,42.22 29.9,42.22 29.9,33.65 32.25,31.23 32.25,22.29 31.22,21.27
5V on Inner2: -0.89,46.92 6.86,46.92 6.86,13.01 -0.89,13.01
5V on Inner2: 32,3.48 32,-2.15 -0.46,-2.15 -2.03,-0.58 -2.03,14.28 -1.4,14.92 20.57,14.92
5V on Inner2: 31.66,45.73 -0.25,45.73 -0.25,61.14 32.38,61.14 34.95,58.58 34.95,39.82 31.99,39.82 31.66,40.15
7.4V on Inner2: 43.05,51.87 55.5,51.87 60.32,47.05 62.23,47.05 62.23,43.46 61.41,42.42 59.38,42.42 54.86,37.9 44.7,37.9 44.7,26.6 43.56,25.46 36.58,25.46 36.58,45.01 39.24,47.68 39.24,48.06
GND on Inner1: -2.67,62.92 97.79,62.92 97.79,-2.48 -2.67,-2.48

Small or netless copper shapes (teardrops, artwork), in the pictures only: 394 on Top Layer, 32 on Bottom Layer

## Text on the board
Top Silkscreen Layer: Zuko V1
